# Altium schematic sheet STM32.SchDoc
size A4; SheetNumber: 1; SheetTotal: 7
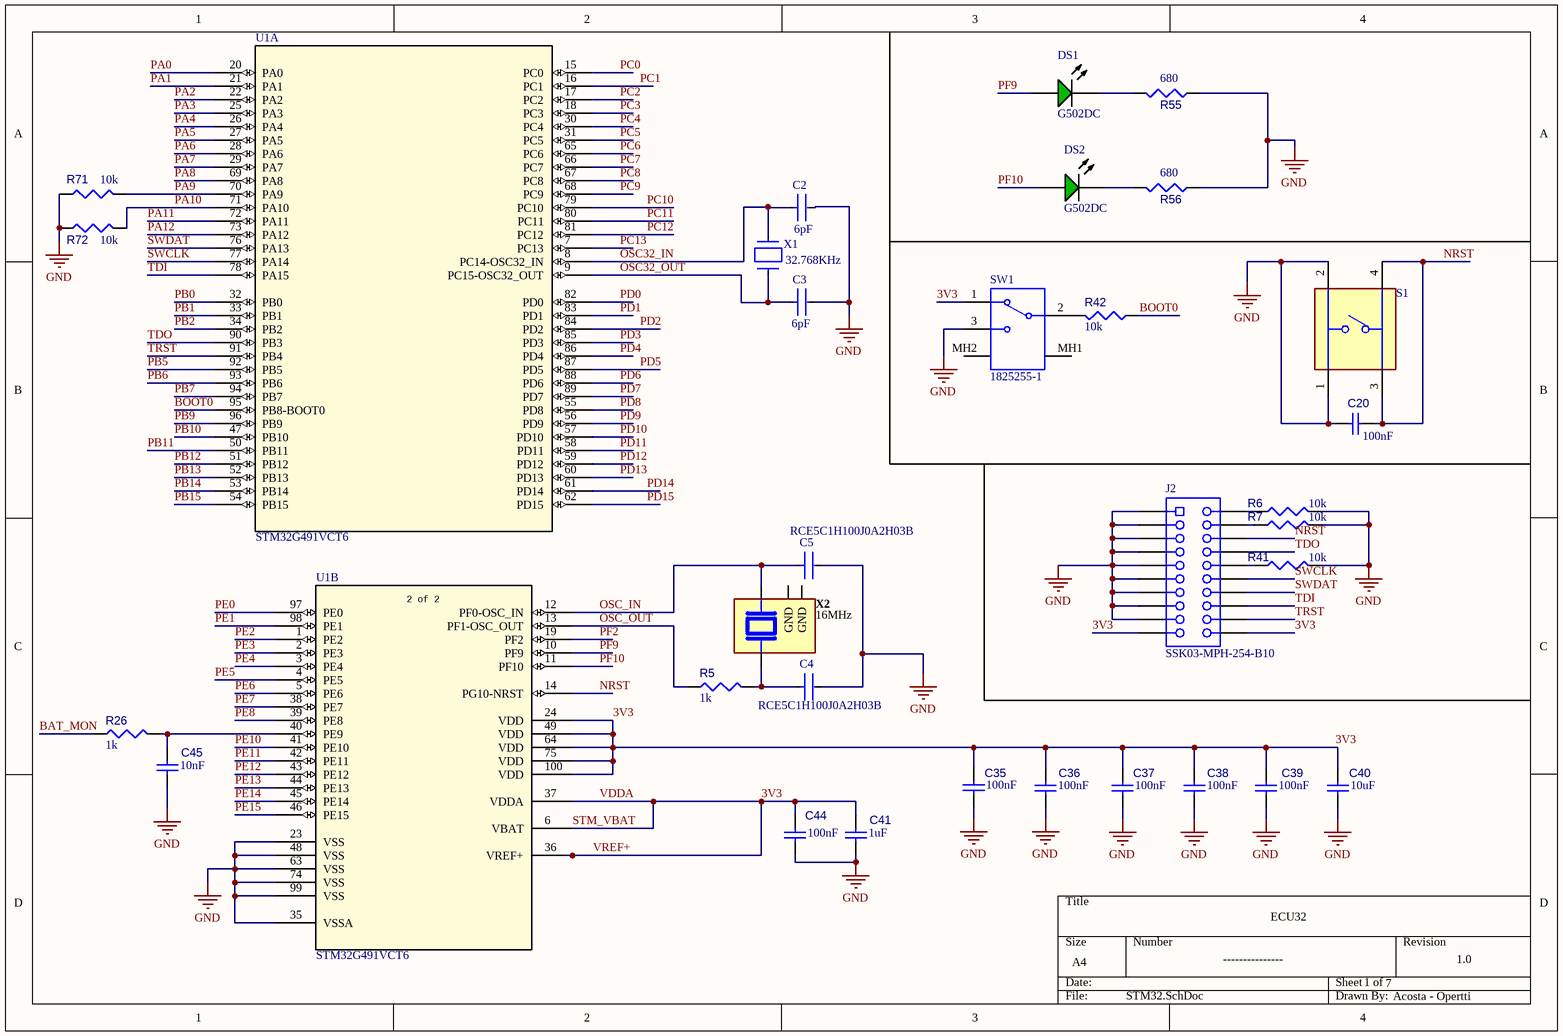
[diagram p0: STM32.SchDoc]

## Parts
C2  Capacitance: 6pF  [FP-RCE0DB-MFG]  (hidden comment: RCE5C1H6R0D0DBH03A)
C3  Capacitance: 6pF  [FP-RCE0DB-MFG]  (hidden comment: RCE5C1H6R0D0DBH03A)
C4  RCE5C1H100J0A2H03B  [FP-RCE0DB-MFG]
C5  RCE5C1H100J0A2H03B  [FP-RCE0DB-MFG]
C20  value 100nF  [Capacitor cerámico TH-Footprint-1]  (hidden comment: Capacitor cerámico TH)
C35  value 100nF  [Capacitor cerámico TH-Footprint-1]  (hidden comment: Capacitor cerámico TH)
C36  value 100nF  [Capacitor cerámico TH-Footprint-1]  (hidden comment: Capacitor cerámico TH)
C37  value 100nF  [Capacitor cerámico TH-Footprint-1]  (hidden comment: Capacitor cerámico TH)
C38  value 100nF  [Capacitor cerámico TH-Footprint-1]  (hidden comment: Capacitor cerámico TH)
C39  value 100nF  [Capacitor cerámico TH-Footprint-1]  (hidden comment: Capacitor cerámico TH)
C40  value 10uF  [Capacitor cerámico TH-Footprint-1]  (hidden comment: Capacitor cerámico TH)
C41  value 1uF  [Capacitor cerámico TH-Footprint-1]  (hidden comment: Capacitor cerámico TH)
C44  value 100nF  [Capacitor cerámico TH-Footprint-1]  (hidden comment: Capacitor cerámico TH)
C45  value 10nF  [Capacitor cerámico TH-Footprint-1]  (hidden comment: Capacitor cerámico TH)
DS1  G502DC  [CGX-G502DC]
DS2  G502DC  [CGX-G502DC]
J2  SSK03-MPH-254-B10  [SAMESKY_SSK03-MPH-254-B10]
R5  value 1k  [RESA60-630X240]  (hidden comment: MFR-25FBF52-47R5)
R6  value 10k  [RESA60-630X240]  (hidden comment: MFR-25FBF52-47R5)
R7  value 10k  [RESA60-630X240]  (hidden comment: MFR-25FBF52-47R5)
R26  value 1k  [RESA60-630X240]  (hidden comment: MFR-25FBF52-47R5)
R41  value 10k  [RESA60-630X240]  (hidden comment: MFR-25FBF52-47R5)
R42  value 10k  [RESA60-630X240]  (hidden comment: MFR-25FBF52-47R5)
R55  value 680  [RESA60-630X240]  (hidden comment: MFR-25FBF52-47R5)
R56  value 680  [RESA60-630X240]  (hidden comment: MFR-25FBF52-47R5)
R71  value 10k  [RESA60-630X240]  (hidden comment: MFR-25FBF52-47R5)
R72  value 10k  [RESA60-630X240]  (hidden comment: MFR-25FBF52-47R5)
S1  TS02-66-43-BK-160-LCR-D  [SW_TS02-66-43-BK-160-LCR-D]  (value not drawn)
SW1  1825255-1  [TECO-1825255-1_V]
U1  STM32G491VCT6  [STM32G491VCT6-Footprint-1]  (parts A,B of 2)
X1  32.768KHz  [FP-ABS07AIG-MFG]
X2  16MHz  [ABM8AIG-16.000MHZ-8-1Z-T-Footprint-1]

## Nets
GND: C2.2 C3.2 C4.2 C5.2 C20.2 C35.1 C36.1 C37.1 C38.1 C39.1 C40.1 C41.1 C44.1 C45.1 J2.1 J2.3 J2.5 J2.7 J2.9 J2.11 J2.13 J2.15 J2.17 R6.2 R7.2 R41.2 R55.2 R56.2 R71.1 R72.1 S1.1 S1.2 SW1.3 U1.23(VSS) U1.35(VSSA) U1.48(VSS) U1.63(VSS) U1.74(VSS) U1.99(VSS)
3V3: C35.2 C36.2 C37.2 C38.2 C39.2 C40.2 C41.2 C44.2 J2.19 J2.20 SW1.1 U1.6(VBAT) U1.24(VDD) U1.36(VREF+) U1.37(VDDA) U1.49(VDD) U1.64(VDD) U1.75(VDD) U1.100(VDD)  [also labelled STM_VBAT, VDDA, VREF+]
BAT_MON: R26.1
BOOT0: R42.1 U1.95(PB8-BOOT0)
NRST: C20.1 J2.6 S1.3 S1.4 U1.14(PG10-NRST)
OSC32_IN: C2.1 U1.8(PC14-OSC32_IN) X1.2
OSC32_OUT: C3.1 U1.9(PC15-OSC32_OUT) X1.1
OSC_IN: C5.1 U1.12(PF0-OSC_IN) X2.3
OSC_OUT: R5.1 U1.13(PF1-OSC_OUT)
PA0: U1.20(PA0)
PA1: U1.21(PA1)
PA2: U1.22(PA2)
PA3: U1.25(PA3)
PA4: U1.26(PA4)
PA5: U1.27(PA5)
PA6: U1.28(PA6)
PA7: U1.29(PA7)
PA8: U1.69(PA8)
PA9: R71.2 U1.70(PA9)
PA10: R72.2 U1.71(PA10)
PA11: U1.72(PA11)
PA12: U1.73(PA12)
PB0: U1.32(PB0)
PB1: U1.33(PB1)
PB2: U1.34(PB2)
PB5: U1.92(PB5)
PB6: U1.93(PB6)
PB7: U1.94(PB7)
PB9: U1.96(PB9)
PB10: U1.47(PB10)
PB11: U1.50(PB11)
PB12: U1.51(PB12)
PB13: U1.52(PB13)
PB14: U1.53(PB14)
PB15: U1.54(PB15)
PC0: U1.15(PC0)
PC1: U1.16(PC1)
PC2: U1.17(PC2)
PC3: U1.18(PC3)
PC4: U1.30(PC4)
PC5: U1.31(PC5)
PC6: U1.65(PC6)
PC7: U1.66(PC7)
PC8: U1.67(PC8)
PC9: U1.68(PC9)
PC10: U1.79(PC10)
PC11: U1.80(PC11)
PC12: U1.81(PC12)
PC13: U1.7(PC13)
PD0: U1.82(PD0)
PD1: U1.83(PD1)
PD2: U1.84(PD2)
PD3: U1.85(PD3)
PD4: U1.86(PD4)
PD5: U1.87(PD5)
PD6: U1.88(PD6)
PD7: U1.89(PD7)
PD8: U1.55(PD8)
PD9: U1.56(PD9)
PD10: U1.57(PD10)
PD11: U1.58(PD11)
PD12: U1.59(PD12)
PD13: U1.60(PD13)
PD14: U1.61(PD14)
PD15: U1.62(PD15)
PE0: U1.97(PE0)
PE1: U1.98(PE1)
PE2: U1.1(PE2)
PE3: U1.2(PE3)
PE4: U1.3(PE4)
PE5: U1.4(PE5)
PE6: U1.5(PE6)
PE7: U1.38(PE7)
PE8: U1.39(PE8)
PE10: U1.41(PE10)
PE11: U1.42(PE11)
PE12: U1.43(PE12)
PE13: U1.44(PE13)
PE14: U1.45(PE14)
PE15: U1.46(PE15)
PF2: U1.19(PF2)
PF9: DS1.1(A) U1.10(PF9)
PF10: DS2.1(A) U1.11(PF10)
SWCLK: J2.12 U1.77(PA14)
SWDAT: J2.14 U1.76(PA13)
TDI: J2.16 U1.78(PA15)
TDO: J2.8 U1.90(PB3)
TRST: J2.18 U1.91(PB4)
NetC4_1: C4.1 R5.2 X2.1
NetC45_2: C45.2 R26.2 U1.40(PE9)
NetDS1_2: DS1.2(K) R55.1
NetDS2_2: DS2.2(K) R56.1
NetJ2_2: J2.2 R6.1
NetJ2_4: J2.4 R7.1
NetJ2_10: J2.10 R41.1
NetR42_2: R42.2 SW1.2

Not connected (* = marked no-connect by the designer): SW1 MH1 MH2; X2 2(GND) 4(GND)

## Notes on the sheet
- ECU32
- ---------------
- 1
- 7
- 1.0
- Acosta - Opertti
- (in symbol CMP-020-00023-1, part B) 2 of 2

## Library data of the parts
C2 C3 = CMP-06035-036149-1: Cap Ceramic 6pF 50V C0G ±0.5pF Radial 2.5mm +125°C Ammo Pack; Lead Diameter: 0.5mm; Lead/Base Style: Straight; Height: 3.5mm; Min Operating Temperature: -55°C; Length: 0.142inch; Termination: Radial; Package Quantity: 2000; Voltage Rating: 50V; Ratings: AEC-Q200; Packaging: Tape and Reel; Max Operating Temperature: 125°C; Height - Seated (Max): 0.138inch; Mount: Through Hole; Lead Pitch: 0.098inch; Width: 0.098inch; Voltage Rating (DC): 50V; Dielectric: C0G; Resistor Type: Ceramic; Case/Package: Radial
C4 C5 = CMP-06035-046743-1: Cap Ceramic 10pF 50V C0G ±5% Radial 2.5mm +125°C Bulk; Lead Diameter: 0.5mm; Lead/Base Style: Straight; Width: 2.5mm; Voltage Rating: 50V; Max Operating Temperature: 125°C; Capacitance: 10pF; Length: 0.142inch; Lead Pitch: 0.098inch; Min Operating Temperature: -55°C; Termination: Radial; Tolerance: 5%; Dielectric: C0G; Packaging: Bulk; Package Quantity: 500; Voltage Rating (DC): 50V; Case/Package: Radial; Ratings: AEC-Q200; Lead Free: Lead Free; Height: 3.5mm; Resistor Type: Ceramic; Height - Seated (Max): 0.138inch; Mount: Through Hole
C20 C35-C41 C44 C45 = CMP-001-00083-4
DS1 DS2 = CMP-007-00008-2: Green LED, 80 mW, 20 mA, -25 to 85 degC, 2-Pin THD; Manufacturer: Shenzhen CGX; Mounting Technology: TH; Package Reference: G502DC; Datasheet Version: Sep-14; Manufacturer URL: http://szcgx.com/; Package Description: 2-Pin Through Hole Device, Dia 5.9 mm; Datasheet URL: http://datasheet.octopart.com/G502DC-Chengguangxing-datasheet-62330340.pdf; Case/Package: G502DC; RoHS Compliant: Unknown
J2 = CMP-002-00074-2: 2.54MM MALE HEADER 2X10PIN, STRA; MF: Same Sky (Formerly CUI Devices); Design Item ID: SSK03-MPH-254-B10; Case/Package: None; Pins: 20; Value: *; MP: SSK03-MPH-254-B10; Component Type: Standard; SnapEDA_Link: https://www.snapeda.com/parts/SSK03-MPH-254-B10/Same+Sky/view-part/?ref=snap; Source: SSK03-MPH-254-B10.SchLib; Check_prices: https://www.snapeda.com/parts/SSK03-MPH-254-B10/Same+Sky/view-part/?ref=eda
R5-R7 R26 R41 R42 R55 R56 R71 R72 = CMP-009-00058-4: Axial Resistor, 47.5 Ohm, +/- 1%, 0.25 W, -55 to 155 degC, 2-Pin THD, RoHS, Bulk; Manufacturer: Yageo; Voltage Rating: 250V; Power: 250mW; Packaging: Bulk; Package Description: 2-Pin Axial Lead, Dia 2.4 mm, Body Length 6.3 mm; Package Reference: MFR-25; Case/Package: Axial; Tolerance: 1%; RoHS Compliant: True; Package Quantity: 200; Max Operating Temperature: 155°C; Manufacturer URL: http://www.yageo.com/; Datasheet URL: http://www.yageo.com/documents/recent/Yageo%20LR_MFR_2013.pdf; Min Operating Temperature: -55°C; Datasheet Version: Apr-13; Mounting Technology: TH
S1 = CMP-011-00014-1: 6 x 6 mm, 4.3 mm Actuator Height, 160 gf, Black, Long Crimped, Through Hole, SPST, Tactile Switch; MF: Same Sky; Check_prices: https://www.snapeda.com/parts/TS02-66-43-BK-160-LCR-D/Same+Sky/view-part/?ref=eda; Component Type: Standard; Pins: 4; Value: *; MP: TS02-66-43-BK-160-LCR-D; SnapEDA_Link: https://www.snapeda.com/parts/TS02-66-43-BK-160-LCR-D/Same+Sky/view-part/?ref=snap; Source: TS02-66-43-BK-160-LCR-D.SchLib; Case/Package: None; Design Item ID: TS02-66-43-BK-160-LCR-D
SW1 = CMP-011-00001-2: Slide Switch, SPDT, 0.3A, 125 V, -20 to 85 degC, 5-Pin THD, RoHS, Tray; Manufacturer: TE Connectivity; Current Rating: 300mA; Voltage Rating (AC): 125V; Max Contact Resistance: 30mohm; Operating Force: 600gf; Manufacturer URL: http://www.te.com/; Max Current Rating: 300mA; Contact Plating: Silver; Contact Material: Copper; Datasheet URL: http://www.te.com/commerce/DocumentDelivery/DDEController?Action=showdoc&DocId=Customer+Drawing%7F1825255%7FA4%7Fpdf%7FEnglish%7FENG_CD_1825255_A4_baseFilename.pdf%7F1825255-1; Throw Configuration: SPDT; Packaging: Bulk; Package Quantity: 560; Max Voltage Rating (AC): 125V; Mounting Technology: TH; RoHS Compliant: True; Case/Package: 1825255-1; Datasheet Version: Rev. A4, 03/2014; Contact Finish: Silver; Package Reference: 1825255-1; Package Description: 5-Pin Through Hole Device, Body 6.7 x 16 mm, Pitch 4 mm; Min Operating Temperature: -20°C; Max Operating Temperature: 85°C
U1 = CMP-020-00023-1: MCU 32-Bit STM32G491 ARM Cortex-M4F RISC 256KB Flash 1.71V to 3.6V 100-Pin LQFP Tray; Case/Package: LQFP; Pins: 100
X1 = CMP-27762-015876-1: Crystal 32.768kHz ±10ppm (Tol) 6pF FUND 70kΩ Automotive 2-Pin Mini-CSMD T/R; ESR (Equivalent Series Resistance): 70kR; Min Operating Temperature: -40°C; Length: 0.126inch; Frequency: 32.768kHz; Load Capacitance: 6pF; RoHS Compliant: Yes; Series: ABS07AIG; Max Operating Temperature: 125°C; Packaging: Cut Tape; Frequency Tolerance: 10ppm; Mount: Surface Mount; Height: 0.035inch; Ratings: AEC-Q200; Width: 0.059inch; Case/Package: SMD/SMT
X2 = CMP-003-00030-1: Crystal 16MHz ±10ppm (Tol) ±50ppm (Stability) 8pF FUND 70Ohm Automotive AEC-Q200 4-Pin CSMD T/R; ESR: 70; Min Operating Temperature: -40°C; Mounting Technology: Surface Mount; Max Operating Temperature: 125°C; Load Capacitance: 8pF; Frequency: 16MHz